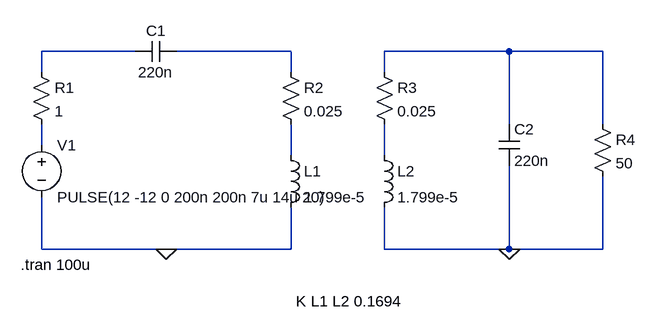
[diagram p0: schematic powertransfer.asc]
powertransfer.asc, the LTspice schematic file:
Version 4.1
SHEET 1 952 680
WIRE 176 32 32 32
WIRE 416 32 240 32
WIRE 752 32 560 32
WIRE 896 32 752 32
WIRE 32 64 32 32
WIRE 416 64 416 32
WIRE 560 64 560 32
WIRE 752 144 752 32
WIRE 896 144 896 32
WIRE 32 176 32 144
WIRE 416 192 416 144
WIRE 560 192 560 144
WIRE 32 336 32 256
WIRE 224 336 32 336
WIRE 416 336 416 272
WIRE 416 336 224 336
WIRE 560 336 560 272
WIRE 752 336 752 208
WIRE 752 336 560 336
WIRE 896 336 896 224
WIRE 896 336 752 336
FLAG 224 336 0
FLAG 752 336 0
SYMBOL voltage 32 160 R0
WINDOW 123 0 0 Left 0
WINDOW 39 0 0 Left 0
SYMATTR InstName V1
SYMATTR Value PULSE(12 -12 0 200n 200n 7u 14u 20)
SYMBOL res 16 48 R0
SYMATTR InstName R1
SYMATTR Value 1
SYMBOL cap 240 16 R90
WINDOW 0 0 32 VBottom 2
WINDOW 3 32 32 VTop 2
SYMATTR InstName C1
SYMATTR Value 220n
SYMBOL res 400 48 R0
SYMATTR InstName R2
SYMATTR Value 0.025
SYMBOL ind 400 176 R0
SYMATTR InstName L1
SYMATTR Value 1.799e-5
SYMATTR Type ind
SYMBOL ind 544 176 R0
SYMATTR InstName L2
SYMATTR Value 1.799e-5
SYMATTR Type ind
SYMBOL res 544 48 R0
SYMATTR InstName R3
SYMATTR Value 0.025
SYMBOL cap 736 144 R0
SYMATTR InstName C2
SYMATTR Value 220n
SYMBOL res 880 128 R0
SYMATTR InstName R4
SYMATTR Value 50
TEXT 0 360 Left 2 !.tran 100u
TEXT 424 416 Left 2 !K L1 L2 0.1694

The netlist it stands for:
* powertransfer.asc
V1 N004 0 PULSE(12 -12 0 200n 200n 7u 14u 20)
R1 N001 N004 1
C1 N002 N001 220n
R2 N002 N005 0.025
L1 N005 0 1.799e-5
L2 N006 0 1.799e-5
R3 N003 N006 0.025
C2 N003 0 220n
R4 N003 0 50
.tran 100u
K L1 L2 0.1694
.backanno
.end